# Altium schematic sheet PIC18F16Q20_Curiosity_Nano_Revision_History.SchDoc
size A3; SheetTitle: Revision History; CompanyName: Microchip Technology Inc.; Organization: Microchip Technology; Address1: 2355 West Chandler Blvd.; Address2: Chandler, AZ  85224; Address4: USA; SheetNumber: 4; SheetTotal: 3; Time: Time
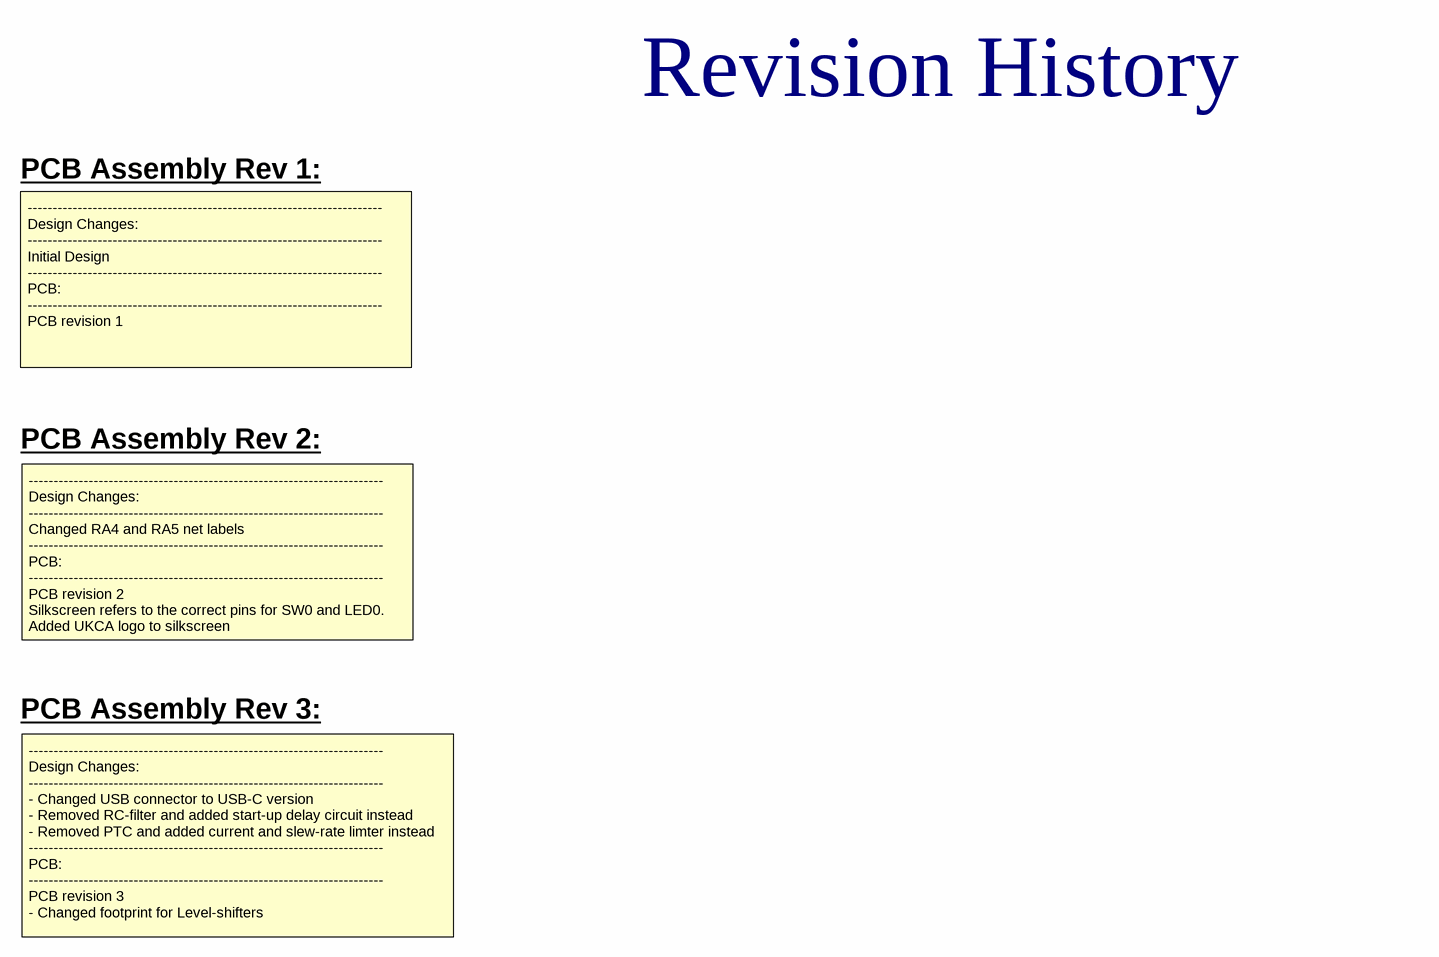
[diagram p0: PIC18F16Q20_Curiosity_Nano_Revision_History.SchDoc]

## Notes on the sheet
- Revision History
- PCB Assembly Rev 1:
- -----------------------------------------------------------------------
  Design Changes:
  -----------------------------------------------------------------------
  Initial Design
  -----------------------------------------------------------------------
  PCB:
  -----------------------------------------------------------------------
  PCB revision 1
- PCB Assembly Rev 2:
- -----------------------------------------------------------------------
  Design Changes:
  -----------------------------------------------------------------------
  Changed RA4 and RA5 net labels
  -----------------------------------------------------------------------
  PCB:
  -----------------------------------------------------------------------
  PCB revision 2
  Silkscreen refers to the correct pins for SW0 and LED0. Added UKCA logo to silkscreen
- PCB Assembly Rev 3:
- -----------------------------------------------------------------------
  Design Changes:
  -----------------------------------------------------------------------
  - Changed USB connector to USB-C version
  - Removed RC-filter and added start-up delay circuit instead
  - Removed PTC and added current and slew-rate limter instead
  -----------------------------------------------------------------------
  PCB:
  -----------------------------------------------------------------------
  PCB revision 3
  - Changed footprint for Level-shifters
- Project Owner:
- PCB Layout Contact:
- PartNumber:
- Project Title
- Variant:
- Sheet Title
- Size
- A3
- SCH #:
- PCB #:
- Rev:
- Date:
- Sheet
- Designed with
- Altium.com <http://go.altium.com/MicrochipLandingPage_Evaluation.html>
- File: